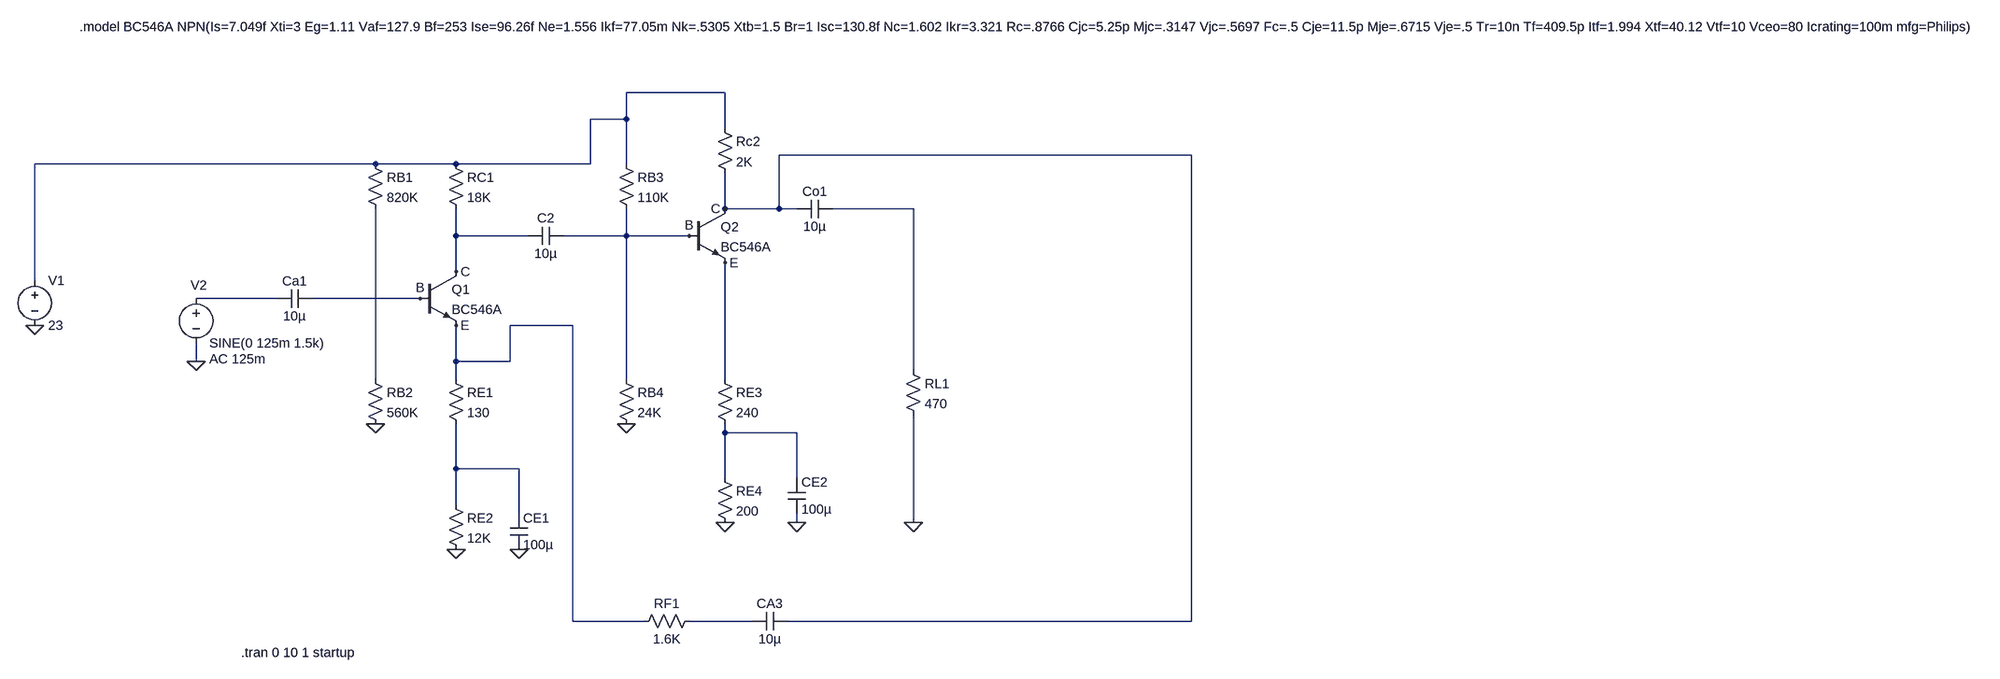
[diagram p0: schematic lazo_cerrado.asc]
lazo_cerrado.asc, the LTspice schematic file:
Version 4.1
SHEET 1 4268 1640
WIRE 1648 624 1472 624
WIRE 1472 672 1472 624
WIRE 1472 672 1408 672
WIRE 1648 688 1648 624
WIRE 2480 736 1744 736
WIRE 1024 752 416 752
WIRE 1168 752 1024 752
WIRE 1408 752 1408 672
WIRE 1408 752 1168 752
WIRE 1472 752 1472 672
WIRE 1648 832 1648 768
WIRE 1744 832 1744 736
WIRE 1744 832 1648 832
WIRE 1776 832 1744 832
WIRE 1984 832 1840 832
WIRE 1168 880 1168 832
WIRE 1296 880 1168 880
WIRE 1472 880 1472 832
WIRE 1472 880 1360 880
WIRE 1584 880 1472 880
WIRE 1168 944 1168 880
WIRE 416 960 416 752
WIRE 848 992 704 992
WIRE 1104 992 912 992
WIRE 1376 1040 1264 1040
WIRE 704 1104 704 1072
WIRE 1168 1104 1168 1040
WIRE 1264 1104 1264 1040
WIRE 1264 1104 1168 1104
WIRE 1984 1120 1984 832
WIRE 1024 1136 1024 832
WIRE 1168 1136 1168 1104
WIRE 1472 1136 1472 880
WIRE 1648 1136 1648 928
WIRE 1648 1232 1648 1216
WIRE 1776 1232 1648 1232
WIRE 1168 1296 1168 1216
WIRE 1280 1296 1168 1296
WIRE 1648 1312 1648 1232
WIRE 1776 1312 1776 1232
WIRE 1168 1360 1168 1296
WIRE 1280 1376 1280 1296
WIRE 1776 1392 1776 1376
WIRE 1984 1392 1984 1200
WIRE 1376 1568 1376 1040
WIRE 1504 1568 1376 1568
WIRE 1696 1568 1584 1568
WIRE 2480 1568 2480 736
WIRE 2480 1568 1760 1568
FLAG 1472 1216 0
FLAG 1280 1440 0
FLAG 1168 1440 0
FLAG 1024 1216 0
FLAG 1648 1392 0
FLAG 1776 1392 0
FLAG 1984 1392 0
FLAG 416 1040 0
FLAG 704 1104 0
FLAG 1168 1040 E
FLAG 1168 944 C
FLAG 1648 832 C
FLAG 1648 928 E
FLAG 1104 992 B
FLAG 1584 880 B
SYMBOL cap 912 976 R90
WINDOW 0 0 32 VBottom 2
WINDOW 3 32 32 VTop 2
SYMATTR InstName Ca1
SYMATTR Value 10µ
SYMATTR Description Capacitor
SYMATTR Type cap
SYMATTR SpiceLine V=10 Irms=0 Rser=2.5 Lser=0 mfg="AVX" pn="TAJC106M010" type="Tantalum"
SYMBOL res 1008 736 R0
SYMATTR InstName RB1
SYMATTR Value 820K
SYMBOL res 1008 1120 R0
SYMATTR InstName RB2
SYMATTR Value 560K
SYMBOL voltage 416 944 R0
WINDOW 123 0 0 Left 0
WINDOW 39 0 0 Left 0
SYMATTR InstName V1
SYMATTR Value 23
SYMBOL npn 1104 944 R0
SYMATTR InstName Q1
SYMATTR Value BC546A
SYMBOL res 1152 736 R0
SYMATTR InstName RC1
SYMATTR Value 18K
SYMBOL res 1152 1120 R0
SYMATTR InstName RE1
SYMATTR Value 130
SYMBOL cap 1296 896 R270
WINDOW 0 32 32 VTop 2
WINDOW 3 0 32 VBottom 2
SYMATTR InstName C2
SYMATTR Value 10µ
SYMATTR Description Capacitor
SYMATTR Type cap
SYMATTR SpiceLine V=16 Irms=0 Rser=11 Lser=0 mfg="AVX" pn="TAJA105K016" type="Tantalum"
SYMBOL res 1152 1344 R0
SYMATTR InstName RE2
SYMATTR Value 12K
SYMBOL cap 1264 1376 R0
WINDOW 3 24 56 Left 2
SYMATTR InstName CE1
SYMATTR Value 100µ
SYMATTR Description Capacitor
SYMATTR Type cap
SYMATTR SpiceLine V=16 Irms=0 Rser=11 Lser=0 mfg="AVX" pn="TAJA105K016" type="Tantalum"
SYMBOL res 1456 736 R0
SYMATTR InstName RB3
SYMATTR Value 110K
SYMBOL res 1632 672 R0
SYMATTR InstName Rc2
SYMATTR Value 2K
SYMBOL npn 1584 832 R0
SYMATTR InstName Q2
SYMATTR Value BC546A
SYMBOL res 1456 1120 R0
SYMATTR InstName RB4
SYMATTR Value 24K
SYMBOL res 1632 1120 R0
SYMATTR InstName RE3
SYMATTR Value 240
SYMBOL cap 1776 848 R270
WINDOW 0 32 32 VTop 2
WINDOW 3 0 32 VBottom 2
SYMATTR InstName Co1
SYMATTR Value 10µ
SYMATTR Description Capacitor
SYMATTR Type cap
SYMATTR SpiceLine V=6.3 Irms=0 Rser=4 Lser=0 mfg="AVX" pn="TAJA106M006" type="Tantalum"
SYMBOL cap 1760 1312 R0
SYMATTR InstName CE2
SYMATTR Value 100µ
SYMATTR Description Capacitor
SYMATTR Type cap
SYMATTR SpiceLine V=16 Irms=0 Rser=0.9 Lser=0 mfg="AVX" pn="TAJE107K016" type="Tantalum"
SYMBOL res 1632 1296 R0
SYMATTR InstName RE4
SYMATTR Value 200
SYMBOL res 1968 1104 R0
SYMATTR InstName RL1
SYMATTR Value 470
SYMBOL res 1600 1552 R90
WINDOW 0 0 56 VBottom 2
WINDOW 3 32 56 VTop 2
SYMATTR InstName RF1
SYMATTR Value 1.6K
SYMBOL cap 1760 1552 R90
WINDOW 0 0 32 VBottom 2
WINDOW 3 32 32 VTop 2
SYMATTR InstName CA3
SYMATTR Value 10µ
SYMATTR Description Capacitor
SYMATTR Type cap
SYMATTR SpiceLine V=6.3 Irms=0 Rser=4 Lser=0 mfg="AVX" pn="TAJA106M006" type="Tantalum"
SYMBOL voltage 704 976 R0
WINDOW 0 -10 -8 Left 2
WINDOW 123 24 124 Left 2
WINDOW 39 0 0 Left 0
SYMATTR InstName V2
SYMATTR Value SINE(0 125m 1.5k)
SYMATTR Value2 AC 125m
TEXT 784 1624 Left 2 !.tran 0 10 1 startup
TEXT 496 328 Left 2 !.model BC546A NPN(Is=7.049f Xti=3 Eg=1.11 Vaf=127.9 Bf=253 Ise=96.26f Ne=1.556 Ikf=77.05m Nk=.5305 Xtb=1.5 Br=1 Isc=130.8f Nc=1.602 Ikr=3.321 Rc=.8766 Cjc=5.25p Mjc=.3147 Vjc=.5697 Fc=.5 Cje=11.5p Mje=.6715 Vje=.5 Tr=10n Tf=409.5p Itf=1.994 Xtf=40.12 Vtf=10 Vceo=80 Icrating=100m mfg=Philips)

The netlist it stands for:
* lazo_cerrado.asc
Ca1 B N003 10µ V=10 Irms=0 Rser=2.5 Lser=0 mfg="AVX" pn="TAJC106M010" type="Tantalum"
RB1 N001 N004 820K
RB2 N004 0 560K
V1 N001 0 23
Q1 C B E 0 BC546A
RC1 N001 C 18K
RE1 E N006 130
C2 C B 10µ V=16 Irms=0 Rser=11 Lser=0 mfg="AVX" pn="TAJA105K016" type="Tantalum"
RE2 N006 0 12K
CE1 N006 0 100µ V=16 Irms=0 Rser=11 Lser=0 mfg="AVX" pn="TAJA105K016" type="Tantalum"
RB3 N001 B 110K
Rc2 N001 C 2K
Q2 C B E 0 BC546A
RB4 B 0 24K
RE3 E N005 240
Co1 C N002 10µ V=6.3 Irms=0 Rser=4 Lser=0 mfg="AVX" pn="TAJA106M006" type="Tantalum"
CE2 N005 0 100µ V=16 Irms=0 Rser=0.9 Lser=0 mfg="AVX" pn="TAJE107K016" type="Tantalum"
RE4 N005 0 200
RL1 N002 0 470
RF1 N007 E 1.6K
CA3 C N007 10µ V=6.3 Irms=0 Rser=4 Lser=0 mfg="AVX" pn="TAJA106M006" type="Tantalum"
V2 N003 0 SINE(0 125m 1.5k) AC 125m
.model NPN NPN
.model PNP PNP
.lib standard.bjt
.tran 0 10 1 startup
.model BC546A NPN(Is=7.049f Xti=3 Eg=1.11 Vaf=127.9 Bf=253 Ise=96.26f Ne=1.556 Ikf=77.05m Nk=.5305 Xtb=1.5 Br=1 Isc=130.8f Nc=1.602 Ikr=3.321 Rc=.8766 Cjc=5.25p Mjc=.3147 Vjc=.5697 Fc=.5 Cje=11.5p Mje=.6715 Vje=.5 Tr=10n Tf=409.5p Itf=1.994 Xtf=40.12 Vtf=10 Vceo=80 Icrating=100m mfg=Philips)
.backanno
.end